# Altium schematic sheet FPGA_Config_Flash.SchDoc
size A4; SheetNumber: 8; SheetTotal: 13
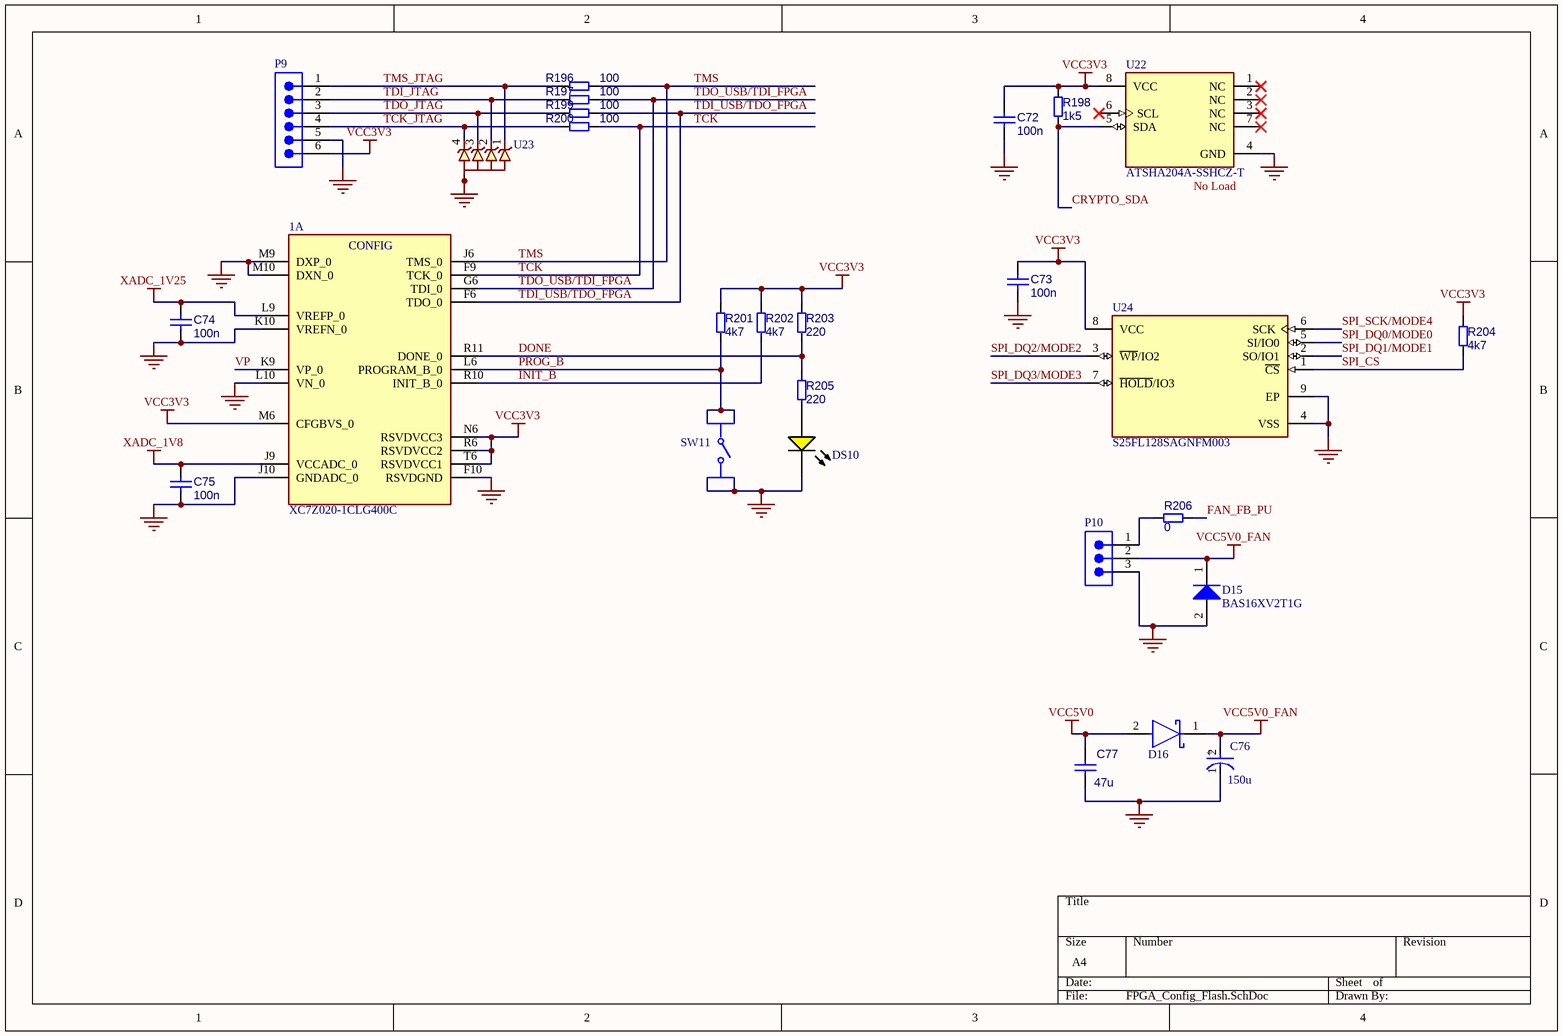
[diagram p0: FPGA_Config_Flash.SchDoc]

## Parts
1  XC7Z020-1CLG400C  [BGA400C80P20X20_1700X1700X160]  (part A of 9)
C72  100n  [CAPC1005X50N_0402]
C73  100n  [CAPC1005X50N_0402]
C74  100n  [CAPC1005X50N_0402]
C75  100n  [CAPC1005X50N_0402]
C76  150u  [FP-TAJD-MFG]
C77  47u  [C_1210]
D15  BAS16XV2T1G  [ONSC-SOD-523-2-502-01_V]
D16  CDBU0130L  [FP-502-01-MFG]  (value not drawn)
DS10  19-217/Y5C-AM1N1VY/3T  [EVRL-0603-2_V]  (value not drawn)
P9  Male Pin Header 1x6 2.54mm  [Copy of Copy of Copy of Copy of 3M-2340-6111TG_V]  (value not drawn)
P10  Male Pin Header 1x3 2.54mm  [Copy of Copy of Copy of Copy of Copy of 3M-2340-6111TG_V]  (value not drawn)
R196  100  [R_0402]
R197  100  [R_0402]
R198  1k5  [R_0402]
R199  100  [R_0402]
R200  100  [R_0402]
R201  4k7  [R_0402]
R202  4k7  [R_0402]
R203  220  [R_0402]
R204  4k7  [R_0402]
R205  220  [R_0402]
R206  0  [R_0402]
SW11  1301.9316.24  [FP-1301_9316_24-MFG]  (value not drawn)
U22  ATSHA204A-SSHCZ-T  [FP-C04-057-IPC_A]
U23  TVS0701DRBR  [FP-DRB0008A-MFG]  (value not drawn)
U24  S25FL128SAGNFM003  [FP-PG-WSON-8-IPC_A]

## Nets
GND: 1.F10(RSVDGND) 1.J10(GNDADC_0) 1.K10(VREFN_0) 1.L10(VN_0) 1.M9(DXP_0) 1.M10(DXN_0) C72.1 C73.1 C74.1 C75.1 C76.1(C) C77.1 D15.2(A) DS10.2(K) P9.5 P10.3 SW11.1 SW11.2 U22.4(GND) U23.5(GND) U23.6(GND) U23.7(GND) U23.8(GND) U23.9(Thermal_Pad) U24.4(VSS) U24.9(EP)
VCC3V3: 1.M6(CFGBVS_0) 1.N6(RSVDVCC3) 1.R6(RSVDVCC2) 1.T6(RSVDVCC1) C72.2 C73.2 P9.6 R198.2 R201.2 R202.2 R203.2 R204.2 U22.8(VCC) U24.8(VCC)
VCC5V0: C77.2 D16.2(A)
VCC5V0_FAN: C76.2(A) D15.1(K) D16.1(C) P10.2
XADC_1V8: 1.J9(VCCADC_0) C75.2
XADC_1V25: 1.L9(VREFP_0) C74.2
CRYPTO_SDA: R198.1 U22.5(SDA)
DONE: 1.R11(DONE_0) R203.1 R205.2
FAN_FB_PU: R206.1
INIT_B: 1.R10(INIT_B_0) R202.1
PROG_B: 1.L6(PROGRAM_B_0) R201.1 SW11.3 SW11.4
SPI_CS: R204.1 U24.1(~{CS})
SPI_DQ0/MODE0: U24.5(SI/IO0)
SPI_DQ1/MODE1: U24.2(SO/IO1)
SPI_DQ2/MODE2: U24.3(~{WP}/IO2)
SPI_DQ3/MODE3: U24.7(~{HOLD}/IO3)
SPI_SCK/MODE4: U24.6(SCK)
TCK: 1.F9(TCK_0) R200.1
TCK_JTAG: P9.4 R200.2 U23.4(IN)
TDI_JTAG: P9.2 R197.2 U23.2(IN)
TDI_USB/TDO_FPGA: 1.F6(TDO_0) R199.1
TDO_JTAG: P9.3 R199.2 U23.3(IN)
TDO_USB/TDI_FPGA: 1.G6(TDI_0) R197.1
TMS: 1.J6(TMS_0) R196.1
TMS_JTAG: P9.1 R196.2 U23.1(IN)
VP: 1.K9(VP_0)
NetDS10_1: DS10.1(A) R205.1
NetP10_1: P10.1 R206.2

Not connected (* = marked no-connect by the designer): U22 1(NC)* 2(NC)* 3(NC)* 6(SCL)* 7(NC)*

## Notes on the sheet
- (near U22) No Load
- (in symbol CMP-04424-000170-1) +
- (in symbol XC7Z020-1CLG400C, part A) CONFIG

## Library data of the parts
1 = XC7Z020-1CLG400C: Integrated Circuit; Manufacturer_Name: AMD; Datasheet Link: http://www.xilinx.com/support/documentation/data_sheets/ds190-Zynq-7000-Overview.pdf; Height: 1.6mm; Manufacturer_Part_Number: XC7Z020-1CLG400C; Mouser Part Number: 217-XC7Z020-1CLG400C; Mouser Price/Stock: https://www.mouser.co.uk/ProductDetail/AMD-Xilinx/XC7Z020-1CLG400C?qs=rrS6PyfT74eaxuOsP%2FGL4g%3D%3D
C72-C75 = CMP-001-00084-2: MLCC 0402
C76 = CMP-04424-000170-1: 47uF 6.3V  ±20% 1.1Ω 2917  SMD Tantalum Capacitor; ESR (Equivalent Series Resistance): 1.1R; Dissipation Factor: 6%; Polarity: Polar; Voltage Rating: 6.3V; Width: 0.169inch; Tolerance: 20%; Series: TAJ; Case/Package: 2917; Max Operating Temperature: 125°C; Depth: 4.3mm; Voltage Rating (DC): 6.3V; Package Quantity: 500; Lead Free: Lead Free; Mount: Surface Mount; Length: 0.287inch; Min Operating Temperature: -55°C; Features: General Purpose; Packaging: Tape and Reel; Capacitance: 47uF; Height - Seated (Max): 0.122inch; RoHS Compliant: Yes
C77 = CMP-001-00088-1: 1210, X5R:EIA, 100uF, DC6.3V, GRM32ER60J107ME20
D15 = CMP-1054-00076-1: Switching Diode, 2-Pin SOD-523, Pb-Free, Tape and Reel; Manufacturer: On Semiconductor; trr Max (ns): 6; Configuration: Single; IF Max (A): 0.2; ComponentLink1URL: http://www.onsemi.com/; DatasheetVersion: Rev. 7; RoHS: TRUE; PackageVersion: Rev. E, 09/2010; Packing: Tape and Reel; ComponentLink2Description: Datasheet; ComponentLink2URL: http://www.onsemi.com/pub_link/Collateral/BAS16XV2T1-D.PDF; ComponentLink3Description: Package Specification; PackageReference: SOD-523-2-502-01; ComponentLink1Description: Manufacturer URL; PartNumber: BAS16XV2T1G; Mounting Technology: Surface Mount; PackageDescription: 2-Pin SOD, Body 1.2 x 0.8 mm; ComponentLink3URL: http://www.onsemi.com/pub_link/Collateral/502-01.PDF
D16 = CMP-07162-000019-1: DIODE SCHOTTKY 30V 200MA SOD523F; Manufacturer Part Number: BAT43XV2; Manufacturer: ON Semiconductor; Max Surge Forward Current: 4A; Max Junction Temp: +125°C; Value: 7pF; Peak Reverse Current: 0.5uA; ComponentLink2Description: Datasheet; Max Repetitive Reverse Voltage: 30V; Octopart: https://octopart.com/bat43xv2-on+semiconductor-84324519; Lead Free: Yes; Package: 502-01; Category: Diode; Device Class L3: Schottky Diodes; Capacitance: 7pF; Footprint Url: https://www.onsemi.com/pub/Collateral/502-01.PDF; Device Class L1: Discrete Semiconductors; Mouser Description: Schottky Diodes & Rectifiers Schottky Barrier Diode; Temperature Range High: +125°C; Device Class L2: Diodes; Temperature: to +125°C; Automotive: No; Forward Current: 200mA; RoHS: TRUE; ComponentLink2URL: https://www.onsemi.com/pub/Collateral/BAT43XV2-D.PDF; Reverse Voltage: 30V; Height: 0.7mm; Digikey Description: DIODE SCHOTTKY 30V 200MA SOD523F
DS10 = CMP-007-00005-2: Chip LED, Yellow, 5 V, 25mA, -40 to 85 degC, 2-Pin SMD (0603), RoHS, Tape and Reel; Manufacturer: Everlight Electronics; Datasheet Version: Rev. 1.0, 12/2005; Package Reference: 0603; Mounting Technology: SM; Package Description: 2-Pin Surface Mount Device, Body 1.6 x 0.8 mm; Case/Package: 0603; Datasheet URL: http://www.fairchip.com/pdf/Everlight/19-217-Y5C-AM1N1VY-3T.pdf; Manufacturer URL: http://www.everlight.com/; RoHS Compliant: False
P9 = CMP-002-00079-1: Male Header, Pitch 2.54 mm, 1x6 Position, Height 8.636 mm, Tail Length 3.05 mm, -55 to 105 degC, RoHS, Bulk; Manufacturer: 3M; Max Current Rating: 3A; Rows: 1; Manufacturer URL: http://www.3m.com/; RoHS Compliant: True; Max Operating Temperature: 105°C; Connector Type: Header; Packaging: Bulk; Pins: 40; Current Rating: 3A; Package Reference: 2340-6111TG; Min Operating Temperature: -55°C; Datasheet Version: Aug-08; Colour: Black; Package Description: Male Header, Pitch 2.54 mm, 1 x 40 Position, Height 8.636 mm, Tail Length 3.05 mm; Contact Finish: Gold; Contact Material: Copper; Case/Package: 2340-6111TG; Contact Plating: Gold; Datasheet URL: https://datasheet.ciiva.com/5161/ts0766-242217-5161112.pdf; Gender: Male; Mounting Technology: TH; Package Quantity: 200; Lead Pitch: 0.1inch
P10 = CMP-002-00080-1: Male Header, Pitch 2.54 mm, 1x3 Position, Height 8.636 mm, Tail Length 3.05 mm, -55 to 105 degC, RoHS, Bulk; Manufacturer: 3M; Rows: 1; Current Rating: 3A; Mounting Technology: TH; Contact Plating: Gold; Packaging: Bulk; Lead Pitch: 0.1inch; Case/Package: 2340-6111TG; Contact Material: Copper; Pins: 40; Package Description: Male Header, Pitch 2.54 mm, 1 x 40 Position, Height 8.636 mm, Tail Length 3.05 mm; RoHS Compliant: True; Connector Type: Header; Manufacturer URL: http://www.3m.com/; Contact Finish: Gold; Max Operating Temperature: 105°C; Min Operating Temperature: -55°C; Max Current Rating: 3A; Gender: Male; Package Quantity: 200; Colour: Black; Package Reference: 2340-6111TG; Datasheet URL: https://datasheet.ciiva.com/5161/ts0766-242217-5161112.pdf; Datasheet Version: Aug-08
R196-R206 = CMP-009-00178-3: Chip 0402 resistor
SW11 = CMP-00030-00001-1: Switch Tactile N.O. SPST Round Button Gull Wing 0.05A 12VDC >100000Cycles 1.6N SMD T/R; Max Operating Temperature: 70°C; Case/Package: SMD/SMT; Mounting Technology: Surface Mount; Min Operating Temperature: -20°C
U22 = CMP-06313-000167-1: IC AUTHENTICATION CHIP 8SOIC; Output Voltage: 400mV; Min Supply Voltage: 2V; Interface: Serial; Density: 4.5Kb; Output Current: 4mA; Access Time: 550ns; Max Frequency: 1MHz; Number of Input Lines: 1; Max Supply Voltage: 5.5V; RoHS Compliant: Yes; Case/Package: SOIC; Lead Free: Lead Free; Weight: 0.019048oz; Min Operating Temperature: -40°C; Series: CryptoAuthentication™; Number of Pins: 8; Packaging: Cut Tape; Package Quantity: 1; Number of Output Lines: 1; Contact Plating: Gold; Mount: Surface Mount; Max Operating Temperature: 85°C
U23 = CMP-031-00006-4: 7-V bidirectional flat-clamp surge protection device 8-SON -40 to 125; Min Operating Temperature: -40°C; Pins: 8; Max Operating Temperature: 125°C
U24 = CMP-00196-112300131-1: S25FL128SAGNFM003 NOR Flash 128Mbit 32M X 4Bit/64M X 2Bit/128M X 1Bit Serial-SPI 8-Pin WSON T/R; Access Time: 8ns; Max Supply Voltage: 3.6V; Memory Size: 16MB; Memory Type: FLASH, NOR; Frequency: 133MHz; Min Supply Voltage: 1.65V; Interface: SPI; Height: 800µm; Min Operating Temperature: -40°C; NexarPartId: 112300131; Max Operating Temperature: 125°C; Ambient Temperature Range High: 125°C